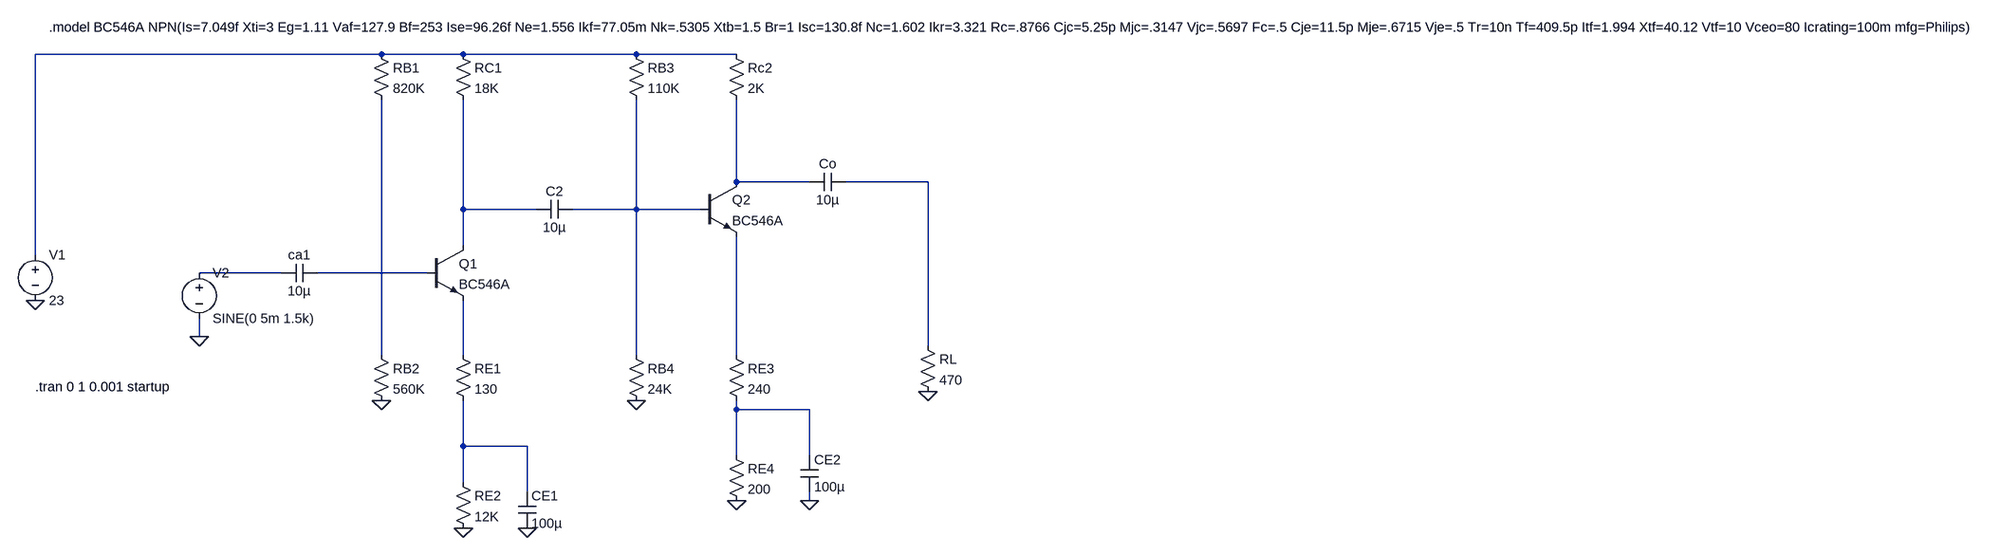
[diagram p0: schematic lazo_abierto.asc]
lazo_abierto.asc, the LTspice schematic file:
Version 4.1
SHEET 1 4084 1704
WIRE 896 -576 288 -576
WIRE 1040 -576 896 -576
WIRE 1344 -576 1040 -576
WIRE 1520 -576 1344 -576
WIRE 1520 -352 1520 -496
WIRE 1648 -352 1520 -352
WIRE 1856 -352 1712 -352
WIRE 1040 -304 1040 -496
WIRE 1168 -304 1040 -304
WIRE 1344 -304 1344 -496
WIRE 1344 -304 1232 -304
WIRE 1456 -304 1344 -304
WIRE 1040 -240 1040 -304
WIRE 288 -224 288 -576
WIRE 720 -192 576 -192
WIRE 976 -192 784 -192
WIRE 576 -80 576 -112
WIRE 1856 -64 1856 -352
WIRE 896 -48 896 -496
WIRE 1040 -48 1040 -144
WIRE 1344 -48 1344 -304
WIRE 1520 -48 1520 -256
WIRE 1520 48 1520 32
WIRE 1648 48 1520 48
WIRE 1040 112 1040 32
WIRE 1152 112 1040 112
WIRE 1520 128 1520 48
WIRE 1648 128 1648 48
WIRE 1040 176 1040 112
WIRE 1152 192 1152 112
WIRE 1648 208 1648 192
FLAG 1344 32 0
FLAG 1152 256 0
FLAG 1040 256 0
FLAG 896 32 0
FLAG 1520 208 0
FLAG 1648 208 0
FLAG 1856 16 0
FLAG 288 -144 0
FLAG 576 -80 0
SYMBOL cap 784 -208 R90
WINDOW 0 0 32 VBottom 2
WINDOW 3 32 32 VTop 2
SYMATTR InstName ca1
SYMATTR Value 10µ
SYMATTR Description Capacitor
SYMATTR Type cap
SYMATTR SpiceLine V=10 Irms=0 Rser=2.5 Lser=0 mfg="AVX" pn="TAJC106M010" type="Tantalum"
SYMBOL res 880 -592 R0
SYMATTR InstName RB1
SYMATTR Value 820K
SYMBOL res 880 -64 R0
SYMATTR InstName RB2
SYMATTR Value 560K
SYMBOL voltage 288 -240 R0
WINDOW 123 0 0 Left 0
WINDOW 39 0 0 Left 0
SYMATTR InstName V1
SYMATTR Value 23
SYMBOL npn 976 -240 R0
SYMATTR InstName Q1
SYMATTR Value BC546A
SYMBOL res 1024 -592 R0
SYMATTR InstName RC1
SYMATTR Value 18K
SYMBOL res 1024 -64 R0
SYMATTR InstName RE1
SYMATTR Value 130
SYMBOL cap 1168 -288 R270
WINDOW 0 32 32 VTop 2
WINDOW 3 0 32 VBottom 2
SYMATTR InstName C2
SYMATTR Value 10µ
SYMATTR Description Capacitor
SYMATTR Type cap
SYMATTR SpiceLine V=16 Irms=0 Rser=11 Lser=0 mfg="AVX" pn="TAJA105K016" type="Tantalum"
SYMBOL res 1024 160 R0
SYMATTR InstName RE2
SYMATTR Value 12K
SYMBOL cap 1136 192 R0
WINDOW 3 24 56 Left 2
SYMATTR InstName CE1
SYMATTR Value 100µ
SYMATTR Description Capacitor
SYMATTR Type cap
SYMATTR SpiceLine V=16 Irms=0 Rser=11 Lser=0 mfg="AVX" pn="TAJA105K016" type="Tantalum"
SYMBOL res 1328 -592 R0
SYMATTR InstName RB3
SYMATTR Value 110K
SYMBOL res 1504 -592 R0
SYMATTR InstName Rc2
SYMATTR Value 2K
SYMBOL npn 1456 -352 R0
SYMATTR InstName Q2
SYMATTR Value BC546A
SYMBOL res 1328 -64 R0
SYMATTR InstName RB4
SYMATTR Value 24K
SYMBOL res 1504 -64 R0
SYMATTR InstName RE3
SYMATTR Value 240
SYMBOL cap 1648 -336 R270
WINDOW 0 32 32 VTop 2
WINDOW 3 0 32 VBottom 2
SYMATTR InstName Co
SYMATTR Value 10µ
SYMATTR Description Capacitor
SYMATTR Type cap
SYMATTR SpiceLine V=6.3 Irms=0 Rser=4 Lser=0 mfg="AVX" pn="TAJA106M006" type="Tantalum"
SYMBOL cap 1632 128 R0
SYMATTR InstName CE2
SYMATTR Value 100µ
SYMATTR Description Capacitor
SYMATTR Type cap
SYMATTR SpiceLine V=16 Irms=0 Rser=0.9 Lser=0 mfg="AVX" pn="TAJE107K016" type="Tantalum"
SYMBOL res 1504 112 R0
SYMATTR InstName RE4
SYMATTR Value 200
SYMBOL res 1840 -80 R0
SYMATTR InstName RL
SYMATTR Value 470
SYMBOL voltage 576 -208 R0
WINDOW 123 0 0 Left 0
WINDOW 39 0 0 Left 0
SYMATTR InstName V2
SYMATTR Value SINE(0 5m 1.5k)
TEXT 312 -624 Left 2 !.model BC546A NPN(Is=7.049f Xti=3 Eg=1.11 Vaf=127.9 Bf=253 Ise=96.26f Ne=1.556 Ikf=77.05m Nk=.5305 Xtb=1.5 Br=1 Isc=130.8f Nc=1.602 Ikr=3.321 Rc=.8766 Cjc=5.25p Mjc=.3147 Vjc=.5697 Fc=.5 Cje=11.5p Mje=.6715 Vje=.5 Tr=10n Tf=409.5p Itf=1.994 Xtf=40.12 Vtf=10 Vceo=80 Icrating=100m mfg=Philips)
TEXT 288 8 Left 2 !.tran 0 1 0.001 startup

The netlist it stands for:
* lazo_abierto.asc
ca1 N007 N006 10µ V=10 Irms=0 Rser=2.5 Lser=0 mfg="AVX" pn="TAJC106M010" type="Tantalum"
RB1 N001 N008 820K
RB2 N008 0 560K
V1 N001 0 23
Q1 N004 N007 N009 0 BC546A
RC1 N001 N004 18K
RE1 N009 N012 130
C2 N004 N005 10µ V=16 Irms=0 Rser=11 Lser=0 mfg="AVX" pn="TAJA105K016" type="Tantalum"
RE2 N012 0 12K
CE1 N012 0 100µ V=16 Irms=0 Rser=11 Lser=0 mfg="AVX" pn="TAJA105K016" type="Tantalum"
RB3 N001 N005 110K
Rc2 N001 N002 2K
Q2 N002 N005 N010 0 BC546A
RB4 N005 0 24K
RE3 N010 N011 240
Co N002 N003 10µ V=6.3 Irms=0 Rser=4 Lser=0 mfg="AVX" pn="TAJA106M006" type="Tantalum"
CE2 N011 0 100µ V=16 Irms=0 Rser=0.9 Lser=0 mfg="AVX" pn="TAJE107K016" type="Tantalum"
RE4 N011 0 200
RL N003 0 470
V2 N006 0 SINE(0 5m 1.5k)
.model NPN NPN
.model PNP PNP
.lib standard.bjt
.model BC546A NPN(Is=7.049f Xti=3 Eg=1.11 Vaf=127.9 Bf=253 Ise=96.26f Ne=1.556 Ikf=77.05m Nk=.5305 Xtb=1.5 Br=1 Isc=130.8f Nc=1.602 Ikr=3.321 Rc=.8766 Cjc=5.25p Mjc=.3147 Vjc=.5697 Fc=.5 Cje=11.5p Mje=.6715 Vje=.5 Tr=10n Tf=409.5p Itf=1.994 Xtf=40.12 Vtf=10 Vceo=80 Icrating=100m mfg=Philips)
.tran 0 1 0.001 startup
.backanno
.end